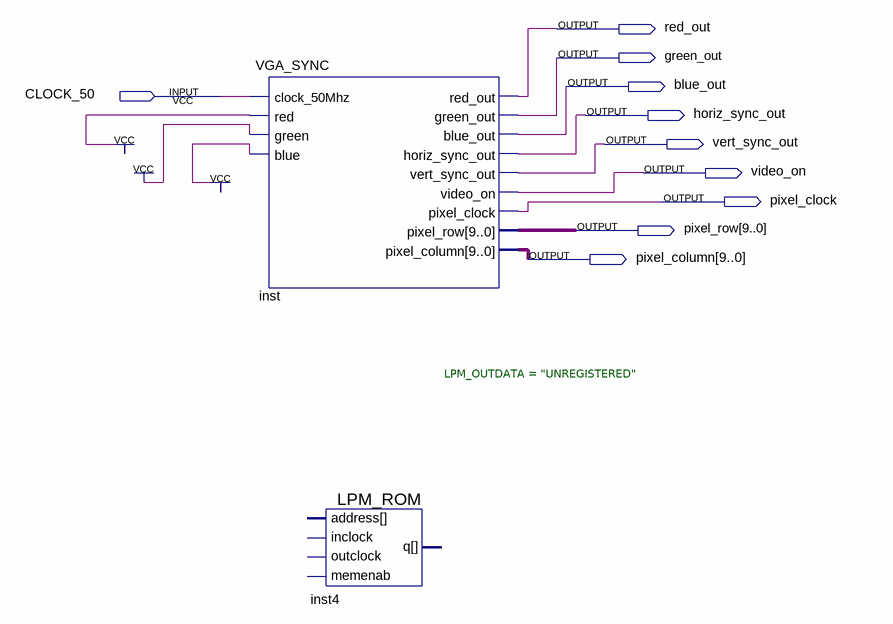
[diagram p0: schematic sheet]
// Quartus schematic lab7.bdf as structural Verilog: 2 symbols, 10 pins
module lab7 (
  input  CLOCK_50,
  output red_out,
  output green_out,
  output blue_out,
  output horiz_sync_out,
  output vert_sync_out,
  output video_on,
  output pixel_clock,
  output [9:0] pixel_row,
  output [9:0] pixel_column
);

  VGA_SYNC inst (
    .clock_50Mhz(CLOCK_50), .red(1'b1), .green(1'b1), .blue(1'b1), .red_out(red_out), .green_out(green_out),
    .blue_out(blue_out), .horiz_sync_out(horiz_sync_out), .vert_sync_out(vert_sync_out), .video_on(video_on),
    .pixel_clock(pixel_clock), .pixel_row(pixel_row), .pixel_column(pixel_column));
  LPM_ROM #(.LPM_OUTDATA("UNREGISTERED")) inst4 ();  // open: address, inclock, outclock, memenab, q
endmodule
